# Altium schematic sheet 03 PWR.SchDoc
size A3; Revision: V1.2; SheetNumber: 3; SheetTotal: 11
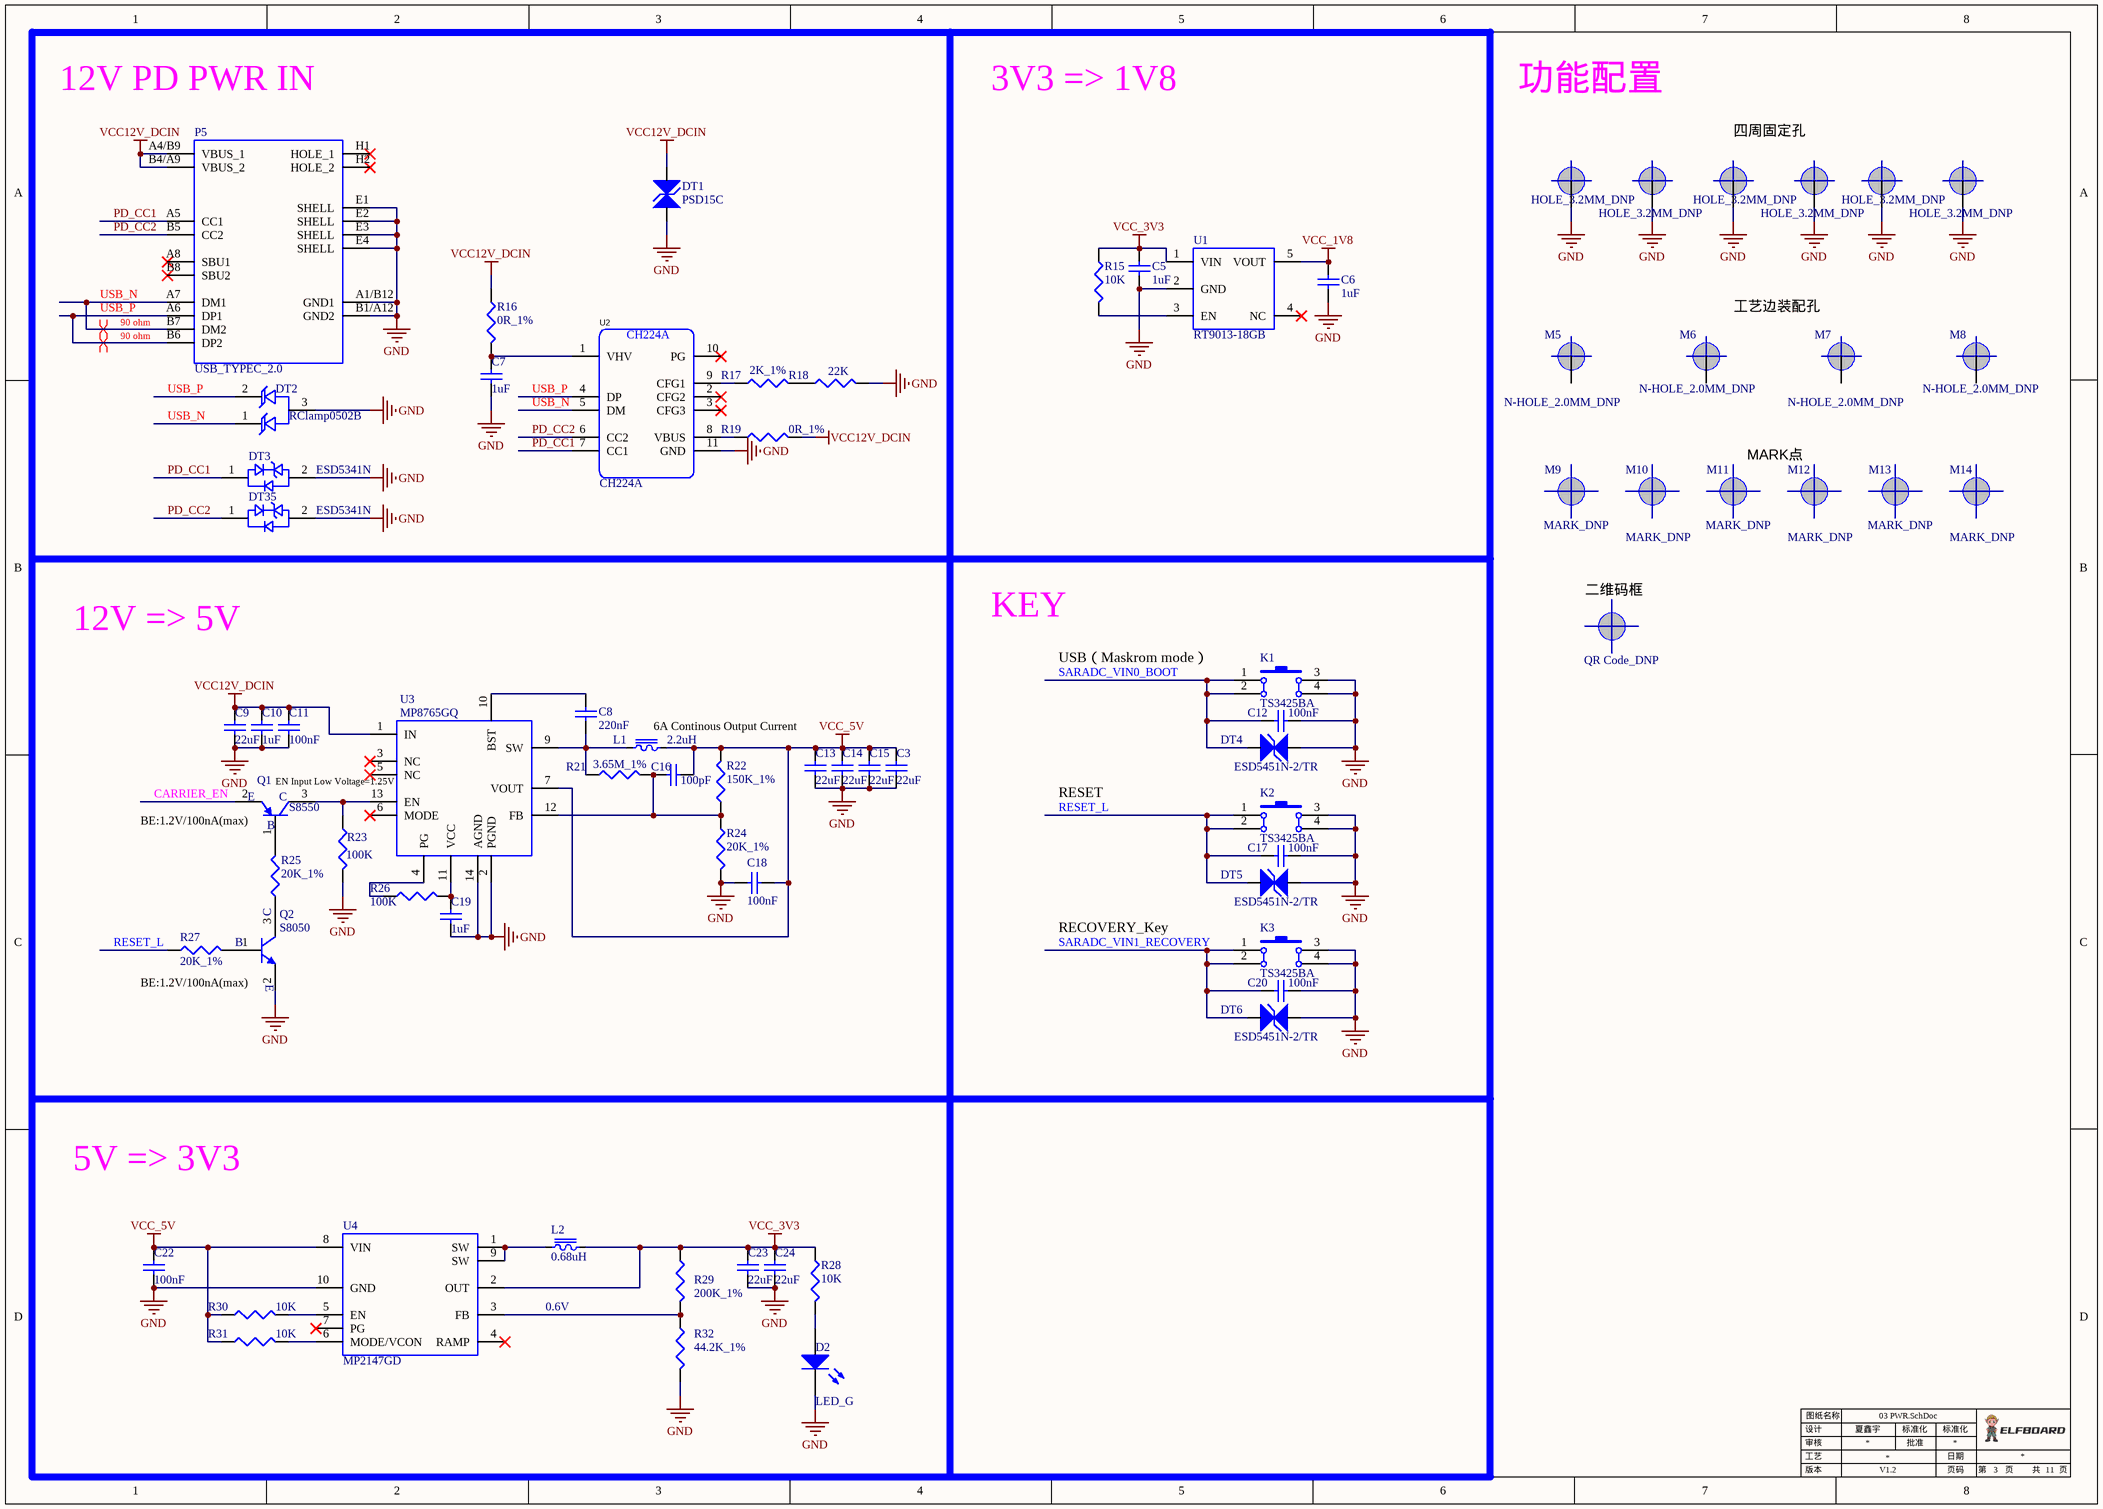
[diagram p0: 03 PWR.SchDoc]

## Parts
C3  22uF  [0805C]
C5  1uF  [0402C]
C6  1uF  [0402C]
C7  1uF  [0402C]
C8  220nF  [0402C]
C9  22uF  [0805C]
C10  1uF  [0603C]
C11  100nF  [0402C]
C12  100nF  [0402C]
C13  22uF  [0805C]
C14  22uF  [0805C]
C15  22uF  [0805C]
C16  100pF  [0402C]
C17  100nF  [0402C]
C18  100nF  [0402C]
C19  1uF  [0402C]
C20  100nF  [0402C]
C22  100nF  [0402C]
C23  22uF  [0805C]
C24  22uF  [0805C]
D2  LED_G  [0603LED_G]
DT1  PSD15C  [SOD_323_D]
DT2  RClamp0502B  [SOT_523]
DT3  ESD5341N  [0402TVS-ESD5341N]
DT4  ESD5451N-2/TR  [0402TVS]
DT5  ESD5451N-2/TR  [0402TVS]
DT6  ESD5451N-2/TR  [0402TVS]
DT35  ESD5341N  [0402TVS-ESD5341N]
K1  TS3425BA  [KEY4-4_6-3_2-H2_5]
K2  TS3425BA  [KEY4-4_6-3_2-H2_5]
K3  TS3425BA  [KEY4-4_6-3_2-H2_5]
L1  2.2uH  [L_4*4*2]
L2  0.68uH  [L_4*4*2]
M1  HOLE_3.2MM_DNP  [HOLE_3.2MM]
M2  HOLE_3.2MM_DNP  [HOLE_3.2MM]
M3  HOLE_3.2MM_DNP  [HOLE_3.2MM]
M4  HOLE_3.2MM_DNP  [HOLE_3.2MM]
M5  N-HOLE_2.0MM_DNP  [N-HOLE_2.0MM]
M6  N-HOLE_2.0MM_DNP  [N-HOLE_2.0MM]
M7  N-HOLE_2.0MM_DNP  [N-HOLE_2.0MM]
M8  N-HOLE_2.0MM_DNP  [N-HOLE_2.0MM]
M9  MARK_DNP  [Mark Point_circle]
M10  MARK_DNP  [Mark Point_circle]
M11  MARK_DNP  [Mark Point_circle]
M12  MARK_DNP  [Mark Point_circle]
M13  MARK_DNP  [Mark Point_circle]
M14  MARK_DNP  [Mark Point_circle]
M15  QR Code_DNP  [QR Code]
M16  HOLE_3.2MM_DNP  [HOLE_3.2MM]
M17  HOLE_3.2MM_DNP  [HOLE_3.2MM]
P5  USB_TYPEC_2.0  [USB_TYPE-C_S]
Q1  S8550  [SOT_233_N]
Q2  S8050  [SOT_233_N]
R15  10K  [0402R]
R16  0R_1%  [0402R]
R17  2K_1%  [0402R]
R18  22K  [0402R]
R19  0R_1%  [0402R]
R21  3.65M_1%  [0603R]
R22  150K_1%  [0402R]
R23  100K  [0402R]
R24  20K_1%  [0402R]
R25  20K_1%  [0402R]
R26  100K  [0402R]
R27  20K_1%  [0402R]
R28  10K  [0402R]
R29  200K_1%  [0402R]
R30  10K  [0402R]
R31  10K  [0402R]
R32  44.2K_1%  [0402R]
U1  RT9013-18GB  [SOT_235]
U2  CH224A  [ESSOP11-1-6X5-H1_8]
U3  MP8765GQ  [QFN16P_MP8765]
U4  MP2147GD  [QFN_2*3]

## Nets
GND: C3.1 C5.1 C6.1 C7.1 C9.1 C10.1 C11.1 C12.1 C13.1 C14.1 C15.1 C17.1 C18.2 C19.1 C20.1 C22.1 C23.1 C24.1 D2.2(K) DT1.1 DT2.3 DT3.2 DT4.2 DT5.2 DT6.2 DT35.2 K1.3 K1.4 K2.3 K2.4 K3.3 K3.4 M1.0(EF) M2.0(EF) M3.0(EF) M4.0(EF) M16.0(EF) M17.0(EF) P5.A1/B12(GND1) P5.B1/A12(GND2) P5.E1(SHELL) P5.E2(SHELL) P5.E3(SHELL) P5.E4(SHELL) Q2.2(E) R18.2 R23.2 R24.2 R32.2 U1.2(GND) U2.11(GND) U3.2(PGND) U3.14(AGND) U4.10(GND)
VCC12V_DCIN: C9.2 C10.2 C11.2 DT1.2 P5.A4/B9(VBUS_1) P5.B4/A9(VBUS_2) R16.1 R19.2 U3.1(IN)
VCC_1V8: C6.2 U1.5(VOUT)
VCC_3V3: C5.2 C23.2 C24.2 L2.2 R15.1 R28.1 R29.1 U1.1(VIN) U4.2(OUT)
VCC_5V: C3.2 C13.2 C14.2 C15.2 C16.2 C18.1 C22.2 L1.2 R22.2 R30.1 R31.1 U3.7(VOUT) U4.8(VIN)
CARRIER_EN: Q1.2(E)
PD_CC1: DT3.1 P5.A5(CC1) U2.7(CC1)
PD_CC2: DT35.1 P5.B5(CC2) U2.6(CC2)
RESET_L: C17.2 DT5.1 K2.1 K2.2 R27.1
SARADC_VIN0_BOOT: C12.2 DT4.1 K1.1 K1.2
SARADC_VIN1_RECOVERY: C20.2 DT6.1 K3.1 K3.2
USB_N: DT2.1 P5.A7(DM1) P5.B7(DM2) U2.5(DM)
USB_P: DT2.2 P5.A6(DP1) P5.B6(DP2) U2.4(DP)
NetC7_2: C7.2 R16.2 U2.1(VHV)
NetC8_1: C8.1 L1.1 R21.1 U3.9(SW)
NetC8_2: C8.2 U3.10(BST)
NetC16_1: C16.1 R21.2 R22.1 R24.1 U3.12(FB)
NetC19_2: C19.2 R26.2 U3.11(VCC)
NetD2_1: D2.1(A) R28.2
NetL2_1: L2.1 U4.1(SW) U4.9(SW)
NetQ1_1: Q1.1(B) R25.2
NetQ1_3: Q1.3(C) R23.1 U3.13(EN)
NetQ2_1: Q2.1(B) R27.2
NetQ2_3: Q2.3(C) R25.1
NetR15_2: R15.2 U1.3(EN)
NetR17_1: R17.1 U2.9(CFG1)
NetR17_2: R17.2 R18.1
NetR19_1: R19.1 U2.8(VBUS)
NetR26_1: R26.1 U3.4(PG)
NetR29_2: R29.2 R32.1 U4.3(FB)
NetR30_2: R30.2 U4.5(EN)
NetR31_2: R31.2 U4.6(MODE/VCON)

Not connected (* = marked no-connect by the designer): M5 0(EF); M6 0(EF); M7 0(EF); M8 0(EF); P5 A8(SBU1)* B8(SBU2)* H1(HOLE_1)* H2(HOLE_2)*; U1 4(NC)*; U2 2(CFG2)* 3(CFG3)* 10(PG)*; U3 3(NC)* 5(NC)* 6(MODE)*; U4 4(RAMP)* 7(PG)*

## Layout directives
differential pair; differential pair class 90 ohm: USB_N, USB_P

## Notes on the sheet
- 12V PD PWR IN
- 3V3 => 1V8
- 功能配置
- 四周固定孔
- 工艺边装配孔
- MARK点
- 12V => 5V
- KEY
- (near M15) 二维码框
- USB（Maskrom mode）
- (near U3) EN Input Low Voltage=1.25V
- (near L1) 6A Continous Output Current
- (near Q1) BE:1.2V/100nA(max)
- RESET
- BE:1.2V/100nA(max)
- RECOVERY_Key
- 5V => 3V3
- 0.6V
- 设计
- 审核
- 工艺
- 图纸名称
- 夏鑫宇
- 批准
- 标准化
- 日期
- 版本
- 页码
- 第
- 页
- 共

## Library data of the parts
C3 C9 C13-C15 = 1110204012: 序号: 747; 存货名称: 贴装叠层陶瓷电容; 规格型号: 0805,22uF,16V,±20％,X5R; 禁用状态: 否; Published: 8-Jun-2000; LatestRevisionDate: 17-Jul-2002; LatestRevisionNote: Re-released for DXP Platform.; PackageReference: RAD-0.3; Publisher: Altium Limited; PackageDescription: Radial Cap, Thru-Hole; 2 Leads; 0.3 in Pin Spacing; Value: 22uF; 存货编码: 1110204012
C5-C7 C19 = 1110202021: 序号: 600; 存货名称: 贴装叠层陶瓷电容; 规格型号: 0402,1uF,16V,±10％,X5R; Published: 8-Jun-2000; LatestRevisionDate: 17-Jul-2002; LatestRevisionNote: Re-released for DXP Platform.; PackageReference: RAD-0.3; Publisher: Altium Limited; PackageDescription: Radial Cap, Thru-Hole; 2 Leads; 0.3 in Pin Spacing; Value: 1uF; 存货编码: 1110202021
C8 = 1110202042: 存货名称: 贴装叠层陶瓷电容; 规格型号: 0402,220nF,25V,±10％,X5R; Published: 8-Jun-2000; LatestRevisionDate: 17-Jul-2002; LatestRevisionNote: Re-released for DXP Platform.; PackageReference: RAD-0.3; Publisher: Altium Limited; PackageDescription: Radial Cap, Thru-Hole; 2 Leads; 0.3 in Pin Spacing; Value: 220nF; 存货编码: 1110202042
C10 = 1110203025: 序号: 648; 存货名称: 贴装叠层陶瓷电容; 规格型号: 0603,1uF,25V,±10％,X5R; 描述: 替代010202065; 禁用: #REF!; 近三年购买频次（更新至2023/12/7）: 近三年购买频次,35; Published: 8-Jun-2000; LatestRevisionDate: 17-Jul-2002; LatestRevisionNote: Re-released for DXP Platform.; PackageReference: RAD-0.3; Publisher: Altium Limited; PackageDescription: Radial Cap, Thru-Hole; 2 Leads; 0.3 in Pin Spacing; Value: 1uF; 存货编码: 1110203025; 最近一次购买记录(更新至20231207）: 2023/10/23; 料号建立日期: 2019/7/2
C11 C12 C17 C18 C20 C22 = 1110202039: 序号: 626; 存货名称: 贴装叠层陶瓷电容; 规格型号: 0402,100nF,25V,±10％,X5R; Published: 8-Jun-2000; LatestRevisionDate: 17-Jul-2002; LatestRevisionNote: Re-released for DXP Platform.; PackageReference: RAD-0.3; Publisher: Altium Limited; PackageDescription: Radial Cap, Thru-Hole; 2 Leads; 0.3 in Pin Spacing; Value: 100nF; 存货编码: 1110202039
C16 = 1110202016: 序号: 587; 存货名称: 贴装叠层陶瓷电容; 规格型号: 0402,100pF,50V,±5％,NPO; Published: 8-Jun-2000; LatestRevisionDate: 17-Jul-2002; LatestRevisionNote: Re-released for DXP Platform.; PackageReference: RAD-0.3; Publisher: Altium Limited; PackageDescription: Radial Cap, Thru-Hole; 2 Leads; 0.3 in Pin Spacing; Value: 100pF; 存货编码: 1110202016
C23 C24 = 1110204012: 序号: 747; 存货名称: 贴装叠层陶瓷电容; 规格型号: 0805,22uF,16V,±20％,X5R; 主计量单位名称: 个; 安全库存: 6299; 旧编码: 010203017; 旧规格型号: 0805 22uF 16V ±20％ X5R; Published: 8-Jun-2000; LatestRevisionDate: 17-Jul-2002; LatestRevisionNote: Re-released for DXP Platform.; PackageReference: RAD-0.3; Publisher: Altium Limited; PackageDescription: Radial Cap, Thru-Hole; 2 Leads; 0.3 in Pin Spacing; Value: 22uF; 存货编码: 1110204012
D2 = 1110504013: 序号: 1825; 存货名称: 贴装发光二极管; 规格型号: 0603,透明,翠绿色发光,普通亮度; 禁用状态: 否; Published: 8-Jun-2000; LatestRevisionDate: 17-Jul-2002; LatestRevisionNote: Re-released for DXP Platform.; PackageVersion: Feb-2002; PackageReference: 3.2X1.6X1.1; Publisher: Altium Limited; PackageDescription: SM LED; 2 Flat Leads; Value: LED_G; 存货编码: 1110504013
DT1 = 1110503088: 序号: 7697; 存货名称: TVS管; 规格型号: PSD15C,SOD-323; 描述: LT品牌,替代1110503028; 禁用: 否; 近三年购买频次: 近三年购买频次.3; Value: PSD15C; 存货编码: 1110503088; 最近一次购买记录: 2025/2/20; 料号建立日期: 2024/12/6
DT2 = 1110503016: 序号: 2598; 存货名称: TVS管; 规格型号: RC1amp0502B SOT-523; 主计量单位名称: 只; 安全库存: 2084.00; 旧编码: 010603010; Value: RClamp0502B; 存货编码: 1110503016; 启用日期: 2013/1/1
DT3 DT35 = 1110503052: 序号: 4824; 存货名称: TVS管; 规格型号: ESD5341N-2/TR,0402TVS; value: ESD5341N-2/TR; 禁用状态: 否; 存货编码: 1110503052
DT4-DT6 = 1110503036: 序号: 1805; 存货名称: TVS管; 规格型号: ESD5451N-2/TR,DFN1006-2L; 禁用状态: 否; Value: ESD5451N-2/TR; 存货编码: 1110503036
K1-K3 = 1120105023: 存货名称: 贴装按键开关; 规格型号: 4P,4.6*3.2*2.5mm,白色,正按; 禁用: 否; Published: 24-Mar-1999; LatestRevisionDate: 17-Jul-2002; LatestRevisionNote: Re-released for DXP Platform.; PackageReference: SPST-2; Publisher: Altium Limited; PackageDescription: Switch; 2 Leads; 存货编码: 1120105023; Value: TS3425BA
L1 = 1110301084: 存货名称: 绕线电感; 规格型号: 2.2uH,4*4*2mm,7.6A,平行焊盘,非屏蔽,WPN4020H2R2MT; 禁用状态: 否; Published: 24-Mar-1999; LatestRevisionDate: 17-Jul-2002; LatestRevisionNote: Re-released for DXP Platform.; PackageReference: AXIAL-0.9; Publisher: Altium Limited; PackageDescription: Axial Device, Thru-Hole; 2 Leads; 0.9 in Pin Spacing; Value: 2.2uH; 存货编码: 1110301084
L2 = 1110301092: 存货名称: 绕线电感; 规格型号: 0.68uH±20%,4*4*2mm,11.1A/7.4A,平行焊盘,非屏蔽,WPN4020HR68MT; 描述栏信息: Sunlord; 禁用状态: 否; Published: 24-Mar-1999; LatestRevisionDate: 17-Jul-2002; LatestRevisionNote: Re-released for DXP Platform.; PackageReference: AXIAL-0.9; Publisher: Altium Limited; PackageDescription: Axial Device, Thru-Hole; 2 Leads; 0.9 in Pin Spacing; Value: 0.68uH; 存货编码: 1110301092
M1-M4 M16 M17 = HOLE_3.2MM_DNP: 序号: 32; 存货编码: 0; Value: HOLE_3.2MM_DNP; 安全库存: 0; 旧编码: MHOLE
M9-M14 = MARK_DNP: 序号: 35; 存货编码: 0; 旧编码: MHOLE; Value: MARK_DNP; 安全库存: 0
P5 = 1120102080: 序号: 8624; 存货名称: 贴装USB座; 规格型号: USB616FC-C2014245,USB2.0,type-c,母座,单层,横卧,16pin,(4个插装脚,脚长1.8),雾面; 描述: 深圳爱特姆; Value: USB_TYPEC_2.0; 存货编码: 1120102080
Q1 = 1110502004: 序号: 1754; 存货名称: 三极管; 规格型号: S8550,SOT23-3,PNP; 禁用: #REF!; 近三年购买频次（更新至2023/12/7）: 近三年购买频次,26; Published: 8-Jun-2000; LatestRevisionDate: 17-Jul-2002; LatestRevisionNote: Re-released for DXP Platform.; PackageReference: TO-226-AA; Publisher: Altium Limited; PackageDescription: TO, Flat Index; 3 In-Line, Axial Leads; Body Dia. 4.8mm; Leads 0.55 x 0.51 mm (max); Code_JEDEC: TO-226-AA; VALUE: S8550; 存货编码: 1110502004; 最近一次购买记录(更新至20231207）: 2023/11/29; 料号建立日期: 2019/7/2
Q2 = 1110502003: 序号: 1753; 存货名称: 三极管; 规格型号: S8050,SOT23-3,NPN; 禁用: #REF!; 近三年购买频次（更新至2023/12/7）: 近三年购买频次,31; Published: 8-Jun-2000; LatestRevisionDate: 17-Jul-2002; LatestRevisionNote: Re-released for DXP Platform.; PackageReference: TO-226-AA; Publisher: Altium Limited; PackageDescription: TO, Flat Index; 3 In-Line, Axial Leads; Body Dia. 4.8mm; Leads 0.55 x 0.51 mm (max); Code_JEDEC: TO-226-AA; VALUE: S8050; 存货编码: 1110502003; 最近一次购买记录(更新至20231207）: 2023/10/19; 料号建立日期: 2019/7/2
R15 R28 R30 R31 = 1110102007: 序号: 17; 存货名称: 贴装电阻; 规格型号: 0402,10K,±5％; Value: 10K; 存货编码: 1110102007
R16 R19 = 1110102255: 序号: 5781; 存货名称: 贴装电阻; 规格型号: 0402,0Ω,±1％,风华; 描述: FH/广东风华高新科技股份有限公司; 禁用: 否; 近三年购买频次: 近三年购买频次.14; Value: 0R_1%; 存货编码: 1110102255; 最近一次购买记录: 2025/2/12; 料号建立日期: 2023/10/16
R17 = 1110102069: 序号: 89; 存货名称: 贴装电阻; 规格型号: 0402,2K,±1％; 禁用: #REF!; 近三年购买频次（更新至2023/12/7）: 近三年购买频次,70; Value: 2K_1%; 存货编码: 1110102069; 最近一次购买记录(更新至20231207）: 2023/11/22; 料号建立日期: 2019/7/2
R18 = 1110102092: 序号: 112; 存货名称: 贴装电阻; 规格型号: 0402,22K,±5％; 禁用: #REF!; 近三年购买频次（更新至2023/12/7）: 近三年购买频次,1; Value: 22K; 存货编码: 1110102092; 最近一次购买记录(更新至20231207）: 2023/11/29; 料号建立日期: 2019/7/2
R21 = 1110103252: 存货名称: 贴装电阻; 规格型号: 0603,3.65M,±1％; 禁用状态: 否; Value: 3.65M_1%; 存货编码: 1110103252
R22 = 1110102061: 序号: 79; 存货名称: 贴装电阻; 规格型号: 0402,150K,±1％; Value: 150K_1%; 存货编码: 1110102061
R23 = 1110102004: 序号: 14; 存货名称: 贴装电阻; 规格型号: 0402,100K,±5％; 主计量单位名称: 只; 安全库存: 129124; 旧编码: 010101005; 旧规格型号: 0402-100K ±5％; Value: 100K; 存货编码: 1110102004
R24 = 1110102074: 序号: 106; 存货名称: 贴装电阻; 规格型号: 0402,20K,±1％; Value: 20K_1%; 存货编码: 1110102074
R25 R27 = 1110102074: 序号: 94; 存货名称: 贴装电阻; 规格型号: 0402,20K,±1％; 禁用: 否; 近三年购买频次（更新至2023/12/7）: 近三年购买频次,3; Value: 20K_1%; 存货编码: 1110102074; 最近一次购买记录(更新至20231207）: 2021/12/27; 料号建立日期: 2019/7/2
R26 = 1110102004: 序号: 14; 存货名称: 贴装电阻; 规格型号: 0402,100K,±5％; Value: 100K; 存货编码: 1110102004
R29 = 1110102049: 序号: 63; 存货名称: 贴装电阻; 规格型号: 0402,200K,±1％; Value: 200K_1%; 存货编码: 1110102049
R32 = 1110102127: 序号: 164; 存货名称: 贴装电阻; 规格型号: 0402,44.2K,±1％; Value: 44.2K_1%; 存货编码: 1110102127
U1 = 1110404097: 序号: 2093; 存货名称: 电源; 规格型号: RT9013-18GB,SOT-23-5; Value: RT9013-18GB; 存货编码: 1110404097
U2 = 1110405668: 序号: 8408; 存货名称: 常规IC; 规格型号: CH224A ESSOP10,PD等多快充协议受电芯片,支持 PD3.2,BC1.2; Value: CH224A; 存货编码: 1110405668
U3 = 1110404112: 存货名称: 电源; 规格型号: MP8765GQ,QFN16; 安全库存: 105; 存货编码: 1110404112; Value: MP8765GQ; 旧规格型号: MP8765GQ,QFN16
U4 = 1110404132: 存货名称: 电源; 规格型号: MP2147GD,QFN2×3mm; Value: MP2147GD; 存货编码: 1110404132
M5-M8 = N-HOLE_2.0MM_DNP: Value: N-HOLE_2.0MM_DNP
M15 = QR Code_DNP: Value: QR Code_DNP